# Altium schematic sheet main.SchDoc
size A3; SheetNumber: 1; SheetTotal: 2
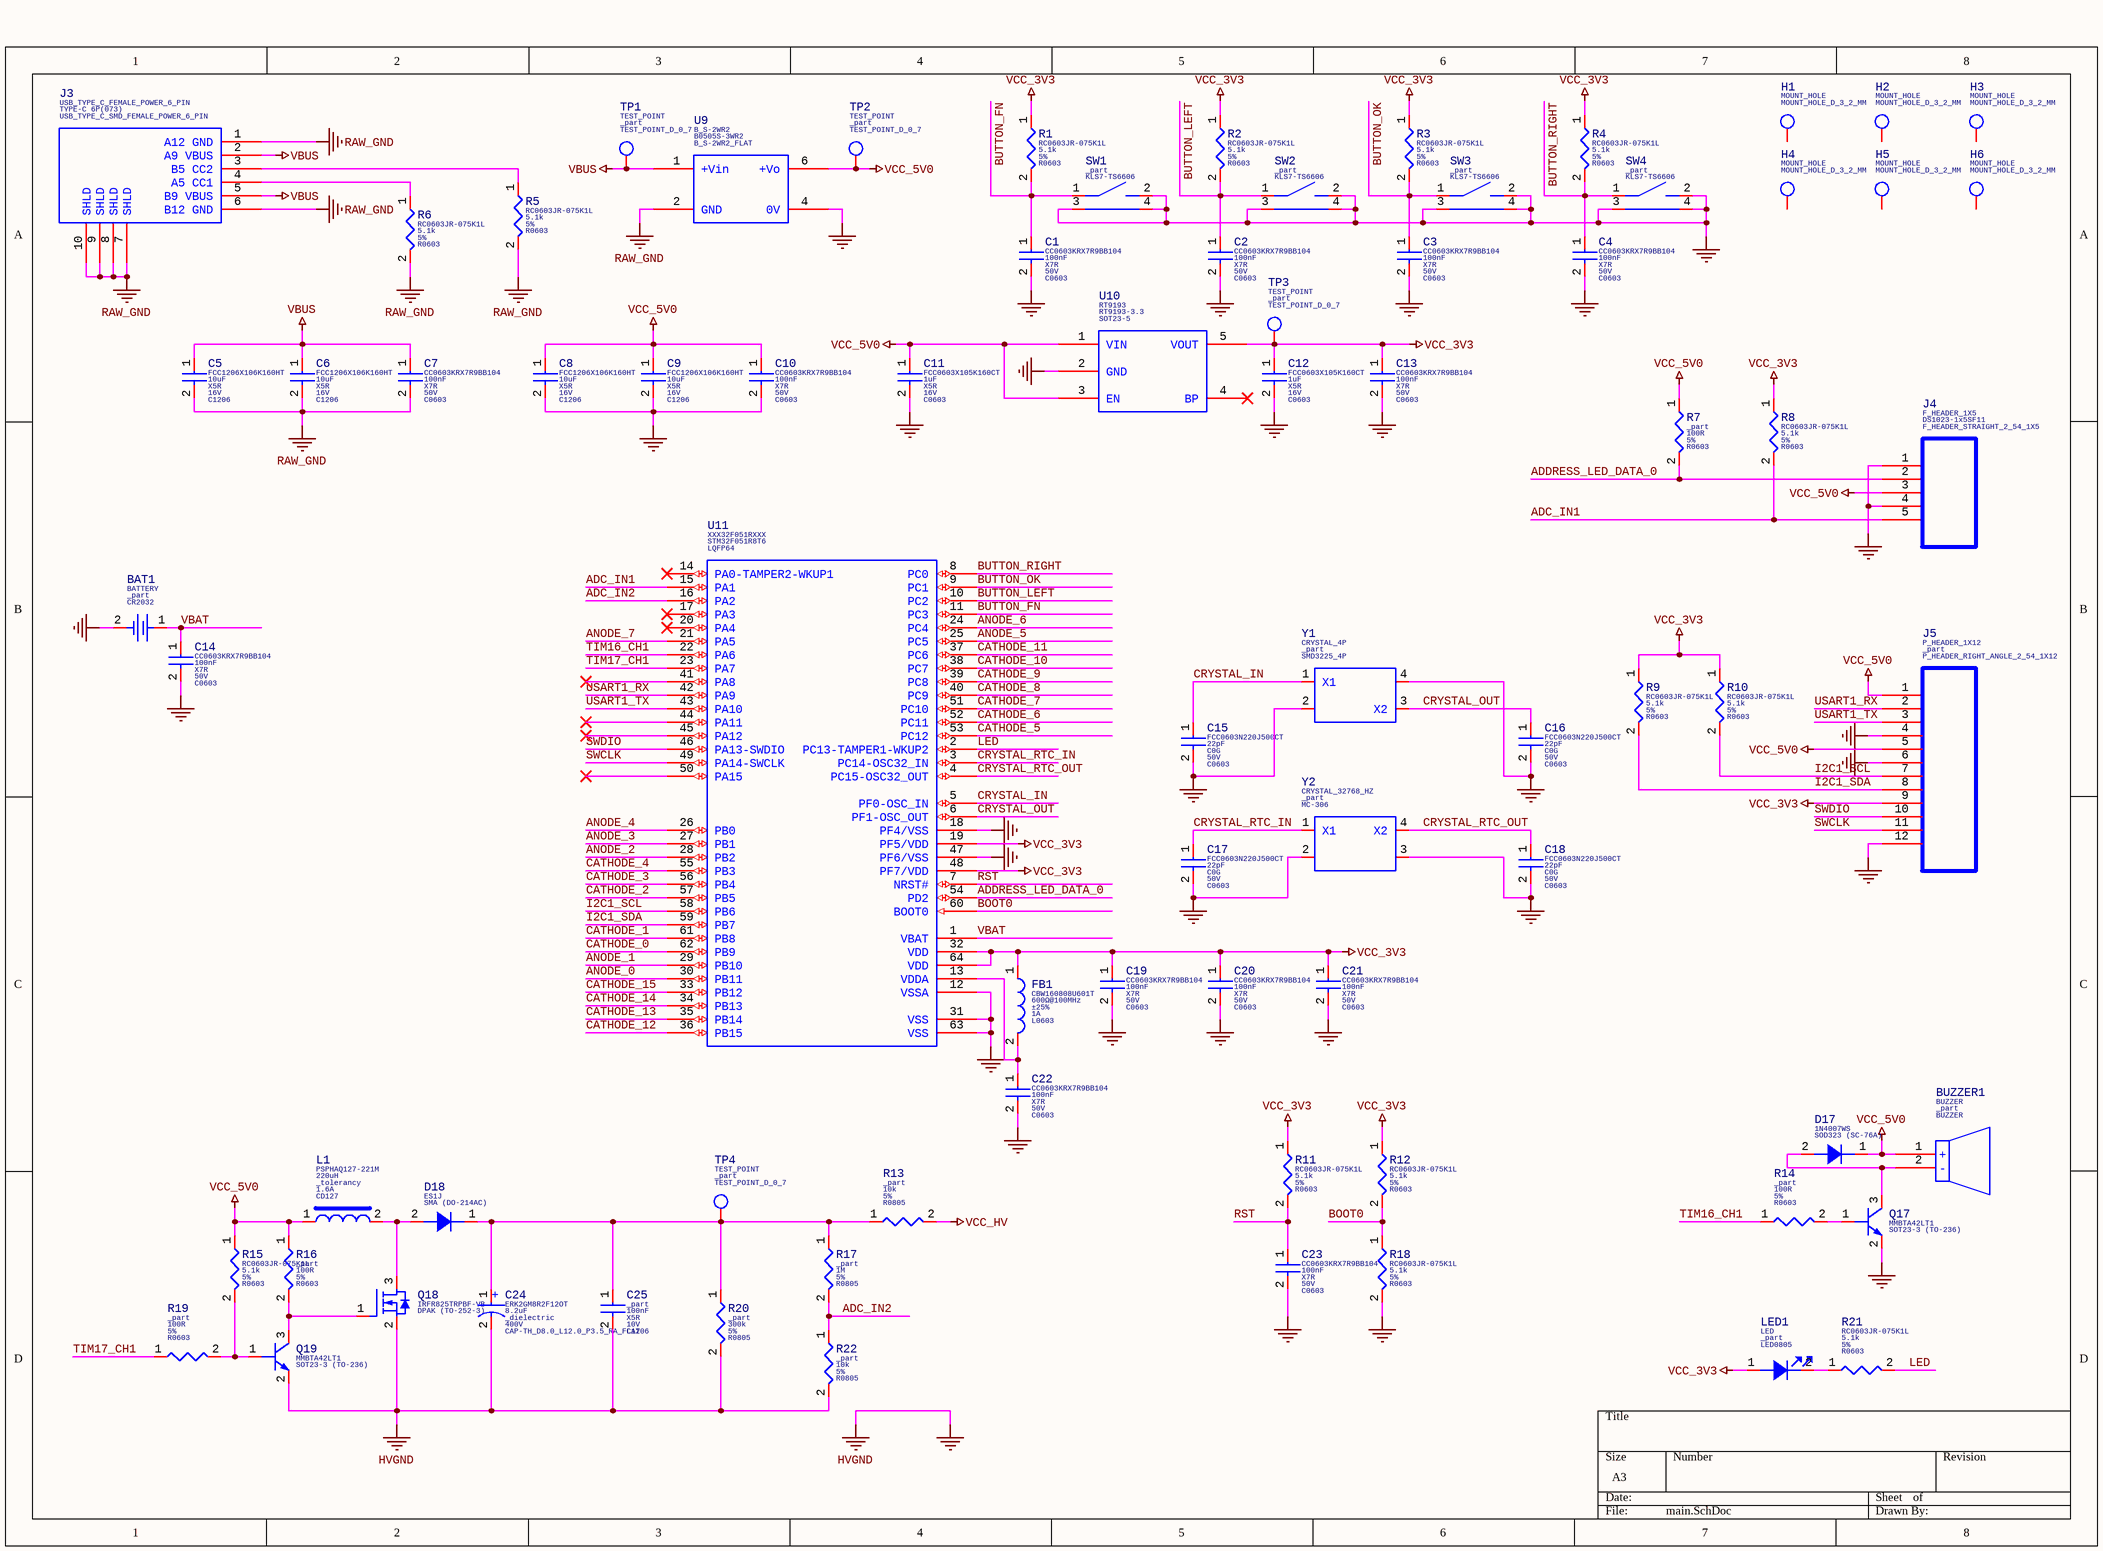
[diagram p0: main.SchDoc]

## Parts
BAT1  BATTERY  Part Reference: _part  [CR2032]
BUZZER1  BUZZER  Part Reference: _part  [BUZZER]
C1  value 100nF  Part Reference: CC0603KRX7R9BB104  Voltage: 50V  Dielectric: X7R  [C0603]  (hidden comment: CAP)
C2  value 100nF  Part Reference: CC0603KRX7R9BB104  Voltage: 50V  Dielectric: X7R  [C0603]  (hidden comment: CAP)
C3  value 100nF  Part Reference: CC0603KRX7R9BB104  Voltage: 50V  Dielectric: X7R  [C0603]  (hidden comment: CAP)
C4  value 100nF  Part Reference: CC0603KRX7R9BB104  Voltage: 50V  Dielectric: X7R  [C0603]  (hidden comment: CAP)
C5  value 10uF  Part Reference: FCC1206X106K160HT  Voltage: 16V  Dielectric: X5R  [C1206]  (hidden comment: CAP)
C6  value 10uF  Part Reference: FCC1206X106K160HT  Voltage: 16V  Dielectric: X5R  [C1206]  (hidden comment: CAP)
C7  value 100nF  Part Reference: CC0603KRX7R9BB104  Voltage: 50V  Dielectric: X7R  [C0603]  (hidden comment: CAP)
C8  value 10uF  Part Reference: FCC1206X106K160HT  Voltage: 16V  Dielectric: X5R  [C1206]  (hidden comment: CAP)
C9  value 10uF  Part Reference: FCC1206X106K160HT  Voltage: 16V  Dielectric: X5R  [C1206]  (hidden comment: CAP)
C10  value 100nF  Part Reference: CC0603KRX7R9BB104  Voltage: 50V  Dielectric: X7R  [C0603]  (hidden comment: CAP)
C11  value 1uF  Part Reference: FCC0603X105K160CT  Voltage: 16V  Dielectric: X5R  [C0603]  (hidden comment: CAP)
C12  value 1uF  Part Reference: FCC0603X105K160CT  Voltage: 16V  Dielectric: X5R  [C0603]  (hidden comment: CAP)
C13  value 100nF  Part Reference: CC0603KRX7R9BB104  Voltage: 50V  Dielectric: X7R  [C0603]  (hidden comment: CAP)
C14  value 100nF  Part Reference: CC0603KRX7R9BB104  Voltage: 50V  Dielectric: X7R  [C0603]  (hidden comment: CAP)
C15  value 22pF  Part Reference: FCC0603N220J500CT  Voltage: 50V  Dielectric: C0G  [C0603]  (hidden comment: CAP)
C16  value 22pF  Part Reference: FCC0603N220J500CT  Voltage: 50V  Dielectric: C0G  [C0603]  (hidden comment: CAP)
C17  value 22pF  Part Reference: FCC0603N220J500CT  Voltage: 50V  Dielectric: C0G  [C0603]  (hidden comment: CAP)
C18  value 22pF  Part Reference: FCC0603N220J500CT  Voltage: 50V  Dielectric: C0G  [C0603]  (hidden comment: CAP)
C19  value 100nF  Part Reference: CC0603KRX7R9BB104  Voltage: 50V  Dielectric: X7R  [C0603]  (hidden comment: CAP)
C20  value 100nF  Part Reference: CC0603KRX7R9BB104  Voltage: 50V  Dielectric: X7R  [C0603]  (hidden comment: CAP)
C21  value 100nF  Part Reference: CC0603KRX7R9BB104  Voltage: 50V  Dielectric: X7R  [C0603]  (hidden comment: CAP)
C22  value 100nF  Part Reference: CC0603KRX7R9BB104  Voltage: 50V  Dielectric: X7R  [C0603]  (hidden comment: CAP)
C23  value 100nF  Part Reference: CC0603KRX7R9BB104  Voltage: 50V  Dielectric: X7R  [C0603]  (hidden comment: CAP)
C24  value 8.2uF  Part Reference: ERK2GM8R2F12OT  Voltage: 400V  Dielectric: _dielectric  [CAP-TH_D8.0_L12.0_P3.5_RA_FLAT]  (hidden comment: CAP_POLAR)
C25  value 100nF  Part Reference: _part  Voltage: 10V  Dielectric: X5R  [C1206]  (hidden comment: CAP)
D17  Part Reference: 1N4007WS  [SOD323 (SC-76A)]  (hidden comment: DIODE)
D18  Part Reference: ES1J  [SMA (DO-214AC)]  (hidden comment: DIODE)
FB1  value 600Ω@100MHz  Part Reference: CBW160808U601T  Current: 1A  Tolerancy: ±25%  [L0603]  (hidden comment: BEAD)
H1  MOUNT_HOLE  [MOUNT_HOLE_D_3_2_MM]  (no BOM)
H2  MOUNT_HOLE  [MOUNT_HOLE_D_3_2_MM]  (no BOM)
H3  MOUNT_HOLE  [MOUNT_HOLE_D_3_2_MM]  (no BOM)
H4  MOUNT_HOLE  [MOUNT_HOLE_D_3_2_MM]  (no BOM)
H5  MOUNT_HOLE  [MOUNT_HOLE_D_3_2_MM]  (no BOM)
H6  MOUNT_HOLE  [MOUNT_HOLE_D_3_2_MM]  (no BOM)
J3  USB_TYPE_C_FEMALE_POWER_6_PIN  Part Reference: TYPE-C 6P(073)  [USB_TYPE_C_SMD_FEMALE_POWER_6_PIN]
J4  F_HEADER_1X5  Part Reference: DS1023-1x5SF11  [F_HEADER_STRAIGHT_2_54_1X5]
J5  P_HEADER_1X12  Part Reference: _part  [P_HEADER_RIGHT_ANGLE_2_54_1X12]  (no BOM)
L1  value 220uH  Part Reference: PSPHAQ127-221M  Current: 1.6A  Tolerancy: _tolerancy  [CD127]  (hidden comment: POWER_INDUCTOR)
LED1  LED  Part Reference: _part  [LED0805]
Q17  Part Reference: MMBTA42LT1  [SOT23-3 (TO-236)]  (hidden comment: NPN)
Q18  Part Reference: IRFR825TRPBF-VB  [DPAK (TO-252-3)]  (hidden comment: MOSFET N)
Q19  Part Reference: MMBTA42LT1  [SOT23-3 (TO-236)]  (hidden comment: NPN)
R1  value 5.1k  Tolerancy: 5%  Part Reference: RC0603JR-075K1L  [R0603]  (hidden comment: RESISTOR)
R2  value 5.1k  Tolerancy: 5%  Part Reference: RC0603JR-075K1L  [R0603]  (hidden comment: RESISTOR)
R3  value 5.1k  Tolerancy: 5%  Part Reference: RC0603JR-075K1L  [R0603]  (hidden comment: RESISTOR)
R4  value 5.1k  Tolerancy: 5%  Part Reference: RC0603JR-075K1L  [R0603]  (hidden comment: RESISTOR)
R5  value 5.1k  Tolerancy: 5%  Part Reference: RC0603JR-075K1L  [R0603]  (hidden comment: RESISTOR)
R6  value 5.1k  Tolerancy: 5%  Part Reference: RC0603JR-075K1L  [R0603]  (hidden comment: RESISTOR)
R7  value 100R  Tolerancy: 5%  Part Reference: _part  [R0603]  (hidden comment: RESISTOR)
R8  value 5.1k  Tolerancy: 5%  Part Reference: RC0603JR-075K1L  [R0603]  (hidden comment: RESISTOR)
R9  value 5.1k  Tolerancy: 5%  Part Reference: RC0603JR-075K1L  [R0603]  (hidden comment: RESISTOR)
R10  value 5.1k  Tolerancy: 5%  Part Reference: RC0603JR-075K1L  [R0603]  (hidden comment: RESISTOR)
R11  value 5.1k  Tolerancy: 5%  Part Reference: RC0603JR-075K1L  [R0603]  (hidden comment: RESISTOR)
R12  value 5.1k  Tolerancy: 5%  Part Reference: RC0603JR-075K1L  [R0603]  (hidden comment: RESISTOR)
R13  value 10k  Tolerancy: 5%  Part Reference: _part  [R0805]  (hidden comment: RESISTOR)
R14  value 100R  Tolerancy: 5%  Part Reference: _part  [R0603]  (hidden comment: RESISTOR)
R15  value 5.1k  Tolerancy: 5%  Part Reference: RC0603JR-075K1L  [R0603]  (hidden comment: RESISTOR)
R16  value 100R  Tolerancy: 5%  Part Reference: _part  [R0603]  (hidden comment: RESISTOR)
R17  value 1M  Tolerancy: 5%  Part Reference: _part  [R0805]  (hidden comment: RESISTOR)
R18  value 5.1k  Tolerancy: 5%  Part Reference: RC0603JR-075K1L  [R0603]  (hidden comment: RESISTOR)
R19  value 100R  Tolerancy: 5%  Part Reference: _part  [R0603]  (hidden comment: RESISTOR)
R20  value 300k  Tolerancy: 5%  Part Reference: _part  [R0805]  (hidden comment: RESISTOR)
R21  value 5.1k  Tolerancy: 5%  Part Reference: RC0603JR-075K1L  [R0603]  (hidden comment: RESISTOR)
R22  value 10k  Tolerancy: 5%  Part Reference: _part  [R0805]  (hidden comment: RESISTOR)
SW1  Part Reference: _part  [KLS7-TS6606]  (hidden comment: TACTILE_SWITCH)
SW2  Part Reference: _part  [KLS7-TS6606]  (hidden comment: TACTILE_SWITCH)
SW3  Part Reference: _part  [KLS7-TS6606]  (hidden comment: TACTILE_SWITCH)
SW4  Part Reference: _part  [KLS7-TS6606]  (hidden comment: TACTILE_SWITCH)
TP1  TEST_POINT  Part Reference: _part  [TEST_POINT_D_0_7]  (no BOM)
TP2  TEST_POINT  Part Reference: _part  [TEST_POINT_D_0_7]  (no BOM)
TP3  TEST_POINT  Part Reference: _part  [TEST_POINT_D_0_7]  (no BOM)
TP4  TEST_POINT  Part Reference: _part  [TEST_POINT_D_0_7]  (no BOM)
U9  B_S-2WR2  Part Reference: B0505S-3WR2  [B_S-2WR2_FLAT]
U10  RT9193  Part Reference: RT9193-3.3  [SOT23-5]
U11  XXX32F051RXXX  Part Reference: STM32F051R8T6  [LQFP64]
Y1  CRYSTAL_4P  Part Reference: _part  [SMD3225_4P]
Y2  CRYSTAL_32768_HZ  Part Reference: _part  [MC-306]

## Nets
GND: BAT1.2 C1.2 C2.2 C3.2 C4.2 C8.2 C9.2 C10.2 C11.2 C12.2 C13.2 C14.2 C15.2 C16.2 C17.2 C18.2 C19.2 C20.2 C21.2 C22.2 C23.2 C24.2 C25.2 J4.1 J4.4 J5.4 J5.6 J5.12 Q17.2(EMITTER) Q18.2(SOURCE) Q19.2(EMITTER) R18.2 R20.2 R22.2 SW1.2 SW1.3 SW1.4 SW2.2 SW2.3 SW2.4 SW3.2 SW3.3 SW3.4 SW4.2 SW4.3 SW4.4 U9.4(0V) U10.2(GND) U11.12(VSSA) U11.18(PF4/VSS) U11.31(VSS) U11.47(PF6/VSS) U11.63(VSS) Y1.2 Y1.4 Y2.2 Y2.3  [also labelled HVGND]
RAW_GND: C5.2 C6.2 C7.2 J3.1(A12_GND) J3.6(B12_GND) J3.7(SHLD) J3.8(SHLD) J3.9(SHLD) J3.10(SHLD) R5.2 R6.2 U9.2(GND)
VBUS: C5.1 C6.1 C7.1 J3.2(A9_VBUS) J3.5(B9_VBUS) TP1.1 U9.1(+Vin)
VCC_3V3: C12.1 C13.1 C19.1 C20.1 C21.1 FB1.1 J5.9 LED1.1(C) R1.1 R2.1 R3.1 R4.1 R8.1 R9.1 R10.1 R11.1 R12.1 TP3.1 U10.5(VOUT) U11.19(PF5/VDD) U11.32(VDD) U11.48(PF7/VDD) U11.64(VDD)
VCC_5V0: BUZZER1.1(+) C8.1 C9.1 C10.1 C11.1 D17.1(C) J4.3 J5.1 J5.5 L1.1 R7.1 R15.1 R16.1 TP2.1 U9.6(+Vo) U10.1(VIN) U10.3(EN)
VCC_HV: R13.2
ADC_IN1: J4.5 R8.2 U11.15(PA1)
ADC_IN2: R17.2 R22.1 U11.16(PA2)
ADDRESS_LED_DATA_0: J4.2 R7.2 U11.54(PD2)
ANODE_0: U11.30(PB11)
ANODE_1: U11.29(PB10)
ANODE_2: U11.28(PB2)
ANODE_3: U11.27(PB1)
ANODE_4: U11.26(PB0)
ANODE_5: U11.25(PC5)
ANODE_6: U11.24(PC4)
ANODE_7: U11.21(PA5)
BOOT0: R12.2 R18.1 U11.60(BOOT0)
BUTTON_FN: C1.1 R1.2 SW1.1 U11.11(PC3)
BUTTON_LEFT: C2.1 R2.2 SW2.1 U11.10(PC2)
BUTTON_OK: C3.1 R3.2 SW3.1 U11.9(PC1)
BUTTON_RIGHT: C4.1 R4.2 SW4.1 U11.8(PC0)
CATHODE_0: U11.62(PB9)
CATHODE_1: U11.61(PB8)
CATHODE_2: U11.57(PB5)
CATHODE_3: U11.56(PB4)
CATHODE_4: U11.55(PB3)
CATHODE_5: U11.53(PC12)
CATHODE_6: U11.52(PC11)
CATHODE_7: U11.51(PC10)
CATHODE_8: U11.40(PC9)
CATHODE_9: U11.39(PC8)
CATHODE_10: U11.38(PC7)
CATHODE_11: U11.37(PC6)
CATHODE_12: U11.36(PB15)
CATHODE_13: U11.35(PB14)
CATHODE_14: U11.34(PB13)
CATHODE_15: U11.33(PB12)
CRYSTAL_IN: C15.1 U11.5(PF0-OSC_IN) Y1.1(X1)
CRYSTAL_OUT: C16.1 U11.6(PF1-OSC_OUT) Y1.3(X2)
CRYSTAL_RTC_IN: C17.1 U11.3(PC14-OSC32_IN) Y2.1(X1)
CRYSTAL_RTC_OUT: C18.1 U11.4(PC15-OSC32_OUT) Y2.4(X2)
I2C1_SCL: J5.7 R10.2 U11.58(PB6)
I2C1_SDA: J5.8 R9.2 U11.59(PB7)
LED: R21.2 U11.2(PC13-TAMPER1-WKUP2)
RST: C23.1 R11.2 U11.7(NRST#)
SWCLK: J5.11 U11.49(PA14-SWCLK)
SWDIO: J5.10 U11.46(PA13-SWDIO)
TIM16_CH1: R14.1 U11.22(PA6)
TIM17_CH1: R19.1 U11.23(PA7)
USART1_RX: J5.2 U11.42(PA9)
USART1_TX: J5.3 U11.43(PA10)
VBAT: BAT1.1 C14.1 U11.1(VBAT)
NetBUZZER1_2: BUZZER1.2(-) D17.2(A) Q17.3(COLLECTOR)
NetC22_1: C22.1 FB1.2 U11.13(VDDA)
NetC24_1: C24.1 C25.1 D18.1(C) R13.1 R17.1 R20.1 TP4.1
NetD18_2: D18.2(A) L1.2 Q18.3(DRAIN)
NetJ3_3: J3.3(B5_CC2) R5.1
NetJ3_4: J3.4(A5_CC1) R6.1
NetLED1_2: LED1.2(A) R21.1
NetQ17_1: Q17.1(BASE) R14.2
NetQ18_1: Q18.1(GATE) Q19.3(COLLECTOR) R16.2
NetQ19_1: Q19.1(BASE) R15.2 R19.2

Not connected (* = marked no-connect by the designer): H1 1; H2 1; H3 1; H4 1; H5 1; H6 1; U10 4(BP)*; U11 14(PA0-TAMPER2-WKUP1)* 17(PA3)* 20(PA4)* 41(PA8)* 44(PA11)* 45(PA12)* 50(PA15)*

## Notes on the sheet
- (in symbol CAP_POLAR) +

## Library data of the parts
BAT1 = BATTERY: Manufacturer: _manufacturer; Procurement Type: DNP; PCB Footprint: CR2032
BUZZER1 = BUZZER: Manufacturer: _manufacturer; PCB Footprint: BUZZER
C1-C4 C7 C10 C13 C14 C19-C23 = CAP: Manufacturer: YAGEO; PCB Footprint: C0603
C5 C6 C8 C9 C15-C18 C25 = CAP: Manufacturer: _manufacturer
  C5 C6 C8 C9 C25: PCB Footprint: C1206
  C15-C18: PCB Footprint: C0603
C11 C12 = CAP: Manufacturer: FOJAN; PCB Footprint: C0603
C24 = CAP_POLAR: CAP ALUM 8.2uF ±20% 400V TH; Manufacturer: AISHI; PCB Footprint: CAP-TH_D8.0_L12.0_P3.5_RA_FLAT
D17 = DIODE: Manufacturer: HXY MOSFET; PCB Footprint: SOD323 (SC-76A)
D18 = DIODE: Manufacturer: _manufacturer; PCB Footprint: SMA (DO-214AC)
FB1 = BEAD: Manufacturer: FH (Guangdong Fenghua Advanced Tech); PCB Footprint: L0603
H1-H6 = MOUNT_HOLE: Manufacturer: _manufacturer; Procurement Type: DNP; PCB Footprint: MOUNT_HOLE_D_3_2_MM
J3 = USB_TYPE_C_FEMALE_POWER_6_PIN: Manufacturer: _manufacturer; PCB Footprint: USB_TYPE_C_SMD_FEMALE_POWER_6_PIN
J4 = F_HEADER_1X5: Manufacturer: CONNFLY Elec; PCB Footprint: F_HEADER_STRAIGHT_2_54_1X5
J5 = P_HEADER_1X12: Manufacturer: _manufacturer; Procurement Type: DNP; PCB Footprint: P_HEADER_RIGHT_ANGLE_2_54_1X12
L1 = POWER_INDUCTOR: Manufacturer: _manufacturer; PCB Footprint: CD127
LED1 = LED: Manufacturer: _manufacturer; PCB Footprint: LED0805
Q17 Q19 = NPN: Manufacturer: _manufacturer; PCB Footprint: SOT23-3 (TO-236)
Q18 = MOSFET N: Manufacturer: VBsemi Elec; PCB Footprint: DPAK (TO-252-3)
R1-R6 R8-R12 R15 R18 R21 = RESISTOR: Manufacturer: YAGEO; PCB Footprint: R0603
R7 R13 R14 R16 R17 R19 R20 R22 = RESISTOR: Manufacturer: _manufacturer
  R7 R14 R16 R19: PCB Footprint: R0603
  R13 R17 R20 R22: PCB Footprint: R0805
SW1-SW4 = TACTILE_SWITCH: Manufacturer: _manufacturer; PCB Footprint: KLS7-TS6606
TP1-TP4 = TEST_POINT: Manufacturer: _manufacturer; PCB Footprint: TEST_POINT_D_0_7
U9 = B_S-2WR2: Manufacturer: EVISUN; PCB Footprint: B_S-2WR2_FLAT
U10 = RT9193: Manufacturer: TDSEMIC; PCB Footprint: SOT23-5
U11 = XXX32F051RXXX: Manufacturer: ST; PCB Footprint: LQFP64
Y1 = CRYSTAL_4P: Manufacturer: _manufacturer; PCB Footprint: SMD3225_4P
Y2 = CRYSTAL_32768_HZ: Manufacturer: _manufacturer; PCB Footprint: MC-306